# Altium schematic sheet Temp Sense.SchDoc: Temperature Sensor
size A4; ApprovedBy: LD Stanton; Author: LD Stanton; CompanyName: University of Cape Town; DrawnBy: Lawrence Stanton; Engineer: Lawrence Stanton; Organization: University of Cape Town; Address1: Department of Electrical Engineering; Address2: Rondebosch; Address3: Cape Town; Address4: South Africa 7701; DocumentNumber: 14; SheetNumber: 14; SheetTotal: 14
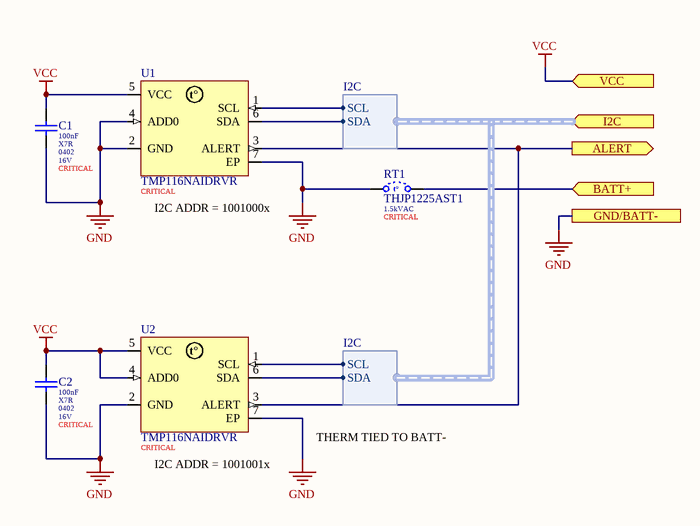
[diagram p0: Temp Sense.SchDoc]

## Parts
C1  value 100nF  Dielectric: X7R  Package: 0402  Voltage: 16V  Populate: CRITICAL  [0402_050_5 (Samsumg) B]  (hidden comment: CL05B104KO5NNNC)
C2  value 100nF  Dielectric: X7R  Package: 0402  Voltage: 16V  Populate: CRITICAL  [0402_050_5 (Samsumg) B]  (hidden comment: CL05B104KO5NNNC)
RT1  THJP1225AST1  Voltage: 1.5kVAC  Placement: CRITICAL  [RESC3264X09N B]
U1  TMP116NAIDRVR  Placement: CRITICAL  [SON (DRV006B) EP B]
U2  TMP116NAIDRVR  Placement: CRITICAL  [SON (DRV006B) EP B]

## Ports
ALERT (out), BATT+ (in), GND/BATT-, I2C (in, harness I2C), VCC (in)

## Harnesses
I2C: SCL, SDA

## Nets
GND: C1.2 C2.2 RT1.1 U1.2(GND) U1.4(ADD0) U1.7(EP) U2.2(GND) U2.7(EP) ; port GND/BATT-
VCC: C1.1 C2.1 U1.5(VCC) U2.4(ADD0) U2.5(VCC) ; port VCC
ALERT: U1.3(ALERT) U2.3(ALERT) ; port ALERT
BATT+: RT1.2 ; port BATT+
NetU1_1: U1.1(SCL) U2.1(SCL) ; port I2C.SCL
NetU1_6: U1.6(SDA) U2.6(SDA) ; port I2C.SDA

## Notes on the sheet
- (near U1) I2C ADDR = 1001000x
- THERM TIED TO BATT-
- (near U2) I2C ADDR = 1001001x
- Size:
- Date:
- A4
- Number:
- Time:
- Revision:
- Sheet
- of
- File:
- Author:
- (in symbol CMP-061-000004-3) t°
- (in symbol CMP-00120-2) t°

## Library data of the parts
C1 C2 = CMP-045-000014-12: MLCC 100nF 0402 16V X7R ±10%; Manufacturer: Samsung; ComponentLink1Description: Datasheet; ComponentLink1URL: https://datasheet.lcsc.com/szlcsc/Samsung-Electro-Mechanics-CL05C100JB5NNNC_C32949.pdf; LCSC Part Number: C1525; Tolerance: ±10%
RT1 = CMP-00120-2: Thermal Jumper 1225 259mW/K 1.5kVAC; LCSC Part Number: C22414428
U1 U2 = CMP-061-000004-3: Digital Temperature Sensor ±0.2°C NV Memory 6-WSON -55 to 125°C; Manufacturer: Texas Instruments; Interface: I2C,SMBus,2-Wire; Resolution: 16b; LCSC Part Number: C182074; ComponentLink1URL: https://www.ti.com/lit/ds/symlink/tmp116.pdf?ts=1635336236311&ref_url=https%253A%252F%252Fwww.google.com%252F; ComponentLink1Description: Datasheet; Max Operating Temperature: 150°C; Package: SON-6; Min Operating Temperature: -55°C